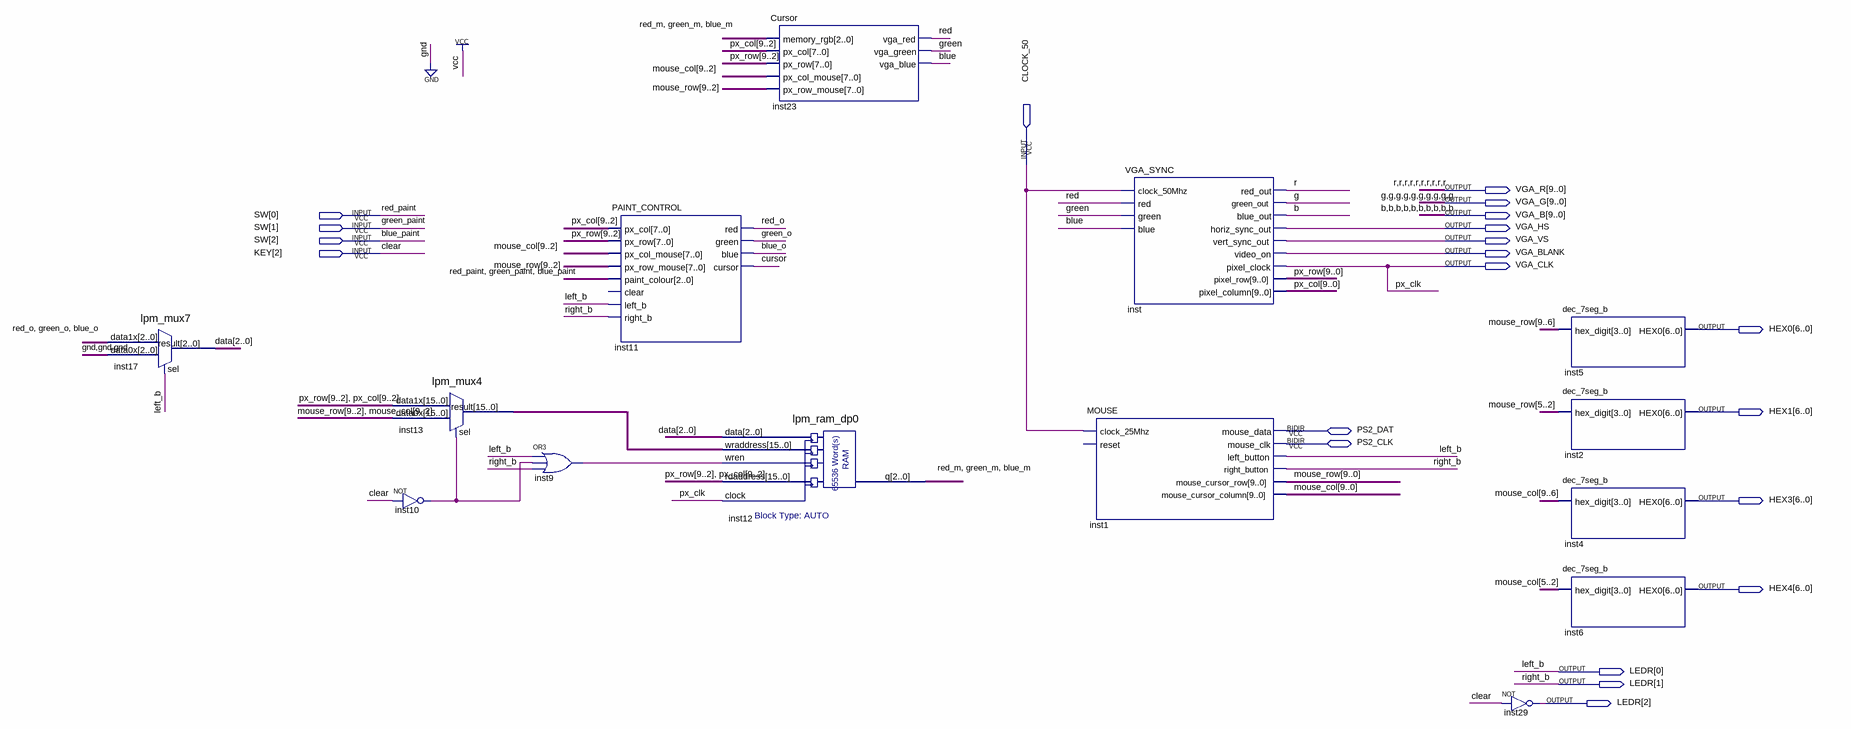
[diagram p0: schematic sheet]
// Quartus schematic PSD_Lab06.bdf as structural Verilog: 14 symbols, 21 pins
module PSD_Lab06 (
  input  CLOCK_50,
  input  [2:0] SW,
  input  [2:2] KEY,
  inout  PS2_DAT,
  inout  PS2_CLK,
  output [9:0] VGA_R,
  output [9:0] VGA_G,
  output [9:0] VGA_B,
  output VGA_HS,
  output VGA_VS,
  output VGA_BLANK,
  output VGA_CLK,
  output [6:0] HEX0,
  output [6:0] HEX1,
  output [6:0] HEX3,
  output [6:0] HEX4,
  output [2:0] LEDR
);

  wire blue, blue_m, blue_o, cursor, green, green_m, green_o, inst9_out, inst10_out, red, red_m, red_o;
  wire [2:0] data;
  wire [9:0] mouse_col, mouse_row, px_col, px_row;
  wire [15:0] inst13_result;

  lpm_mux7 inst17 (.data1x({red_o, green_o, blue_o}), .data0x(3'b000), .sel(LEDR[0]), .result(data));
  lpm_mux4 inst13 (
    .data1x({px_row[9:2], px_col[9:2]}), .data0x({mouse_row[9:2], mouse_col[9:2]}), .sel(inst10_out),
    .result(inst13_result));
  not inst10 (inst10_out, KEY[2]);
  or inst9 (inst9_out, LEDR[0], inst10_out, LEDR[1]);
  PAINT_CONTROL inst11 (
    .px_col(px_col[9:2]), .px_row(px_row[9:2]), .px_col_mouse(mouse_col[9:2]), .px_row_mouse(mouse_row[9:2]),
    .paint_colour({SW[0], SW[1], SW[2]}), .left_b(LEDR[0]), .right_b(LEDR[1]), .red(red_o), .green(green_o),
    .blue(blue_o), .cursor(cursor));  // open: clear
  lpm_ram_dp0 inst12 (
    .data(data), .wraddress(inst13_result), .wren(inst9_out), .rdaddress({px_row[9:2], px_col[9:2]}),
    .clock(VGA_CLK), .q({red_m, green_m, blue_m}));
  Cursor inst23 (
    .memory_rgb({red_m, green_m, blue_m}), .px_col(px_col[9:2]), .px_row(px_row[9:2]),
    .px_col_mouse(mouse_col[9:2]), .px_row_mouse(mouse_row[9:2]), .vga_red(red), .vga_green(green),
    .vga_blue(blue));
  VGA_SYNC inst (
    .clock_50Mhz(CLOCK_50), .red(red), .green(green), .blue(blue), .red_out(VGA_R[9]), .green_out(VGA_G[9]),
    .blue_out(VGA_B[9]), .horiz_sync_out(VGA_HS), .vert_sync_out(VGA_VS), .video_on(VGA_BLANK),
    .pixel_clock(VGA_CLK), .pixel_row(px_row), .pixel_column(px_col));
  MOUSE inst1 (
    .clock_25Mhz(CLOCK_50), .left_button(LEDR[0]), .right_button(LEDR[1]), .mouse_cursor_row(mouse_row),
    .mouse_cursor_column(mouse_col), .mouse_data(PS2_DAT), .mouse_clk(PS2_CLK));  // open: reset
  not inst29 (LEDR[2], KEY[2]);
  dec_7seg_b inst5 (.hex_digit(mouse_row[9:6]), .HEX0(HEX0));
  dec_7seg_b inst2 (.hex_digit(mouse_row[5:2]), .HEX0(HEX1));
  dec_7seg_b inst4 (.hex_digit(mouse_col[9:6]), .HEX0(HEX3));
  dec_7seg_b inst6 (.hex_digit(mouse_col[5:2]), .HEX0(HEX4));

  assign VGA_B[8:0] = {9{VGA_B[9]}};
  assign VGA_G[8:0] = {9{VGA_G[9]}};
  assign VGA_R[8:0] = {9{VGA_R[9]}};

  // Other names for the same wires on the sheet: b = VGA_B[9]; blue_paint = SW[2]; clear = KEY[2]; g = VGA_G[9];
  //   green_paint = SW[1]; left_b = LEDR[0]; px_clk = VGA_CLK; r = VGA_R[9]; red_paint = SW[0]; right_b = LEDR[1]
endmodule
